# Altium schematic sheet VFD-Support-Sheet.SchDoc (part 1 of 3)
size 420 x 297 mm; SheetNumber: 13; SheetTotal: 15
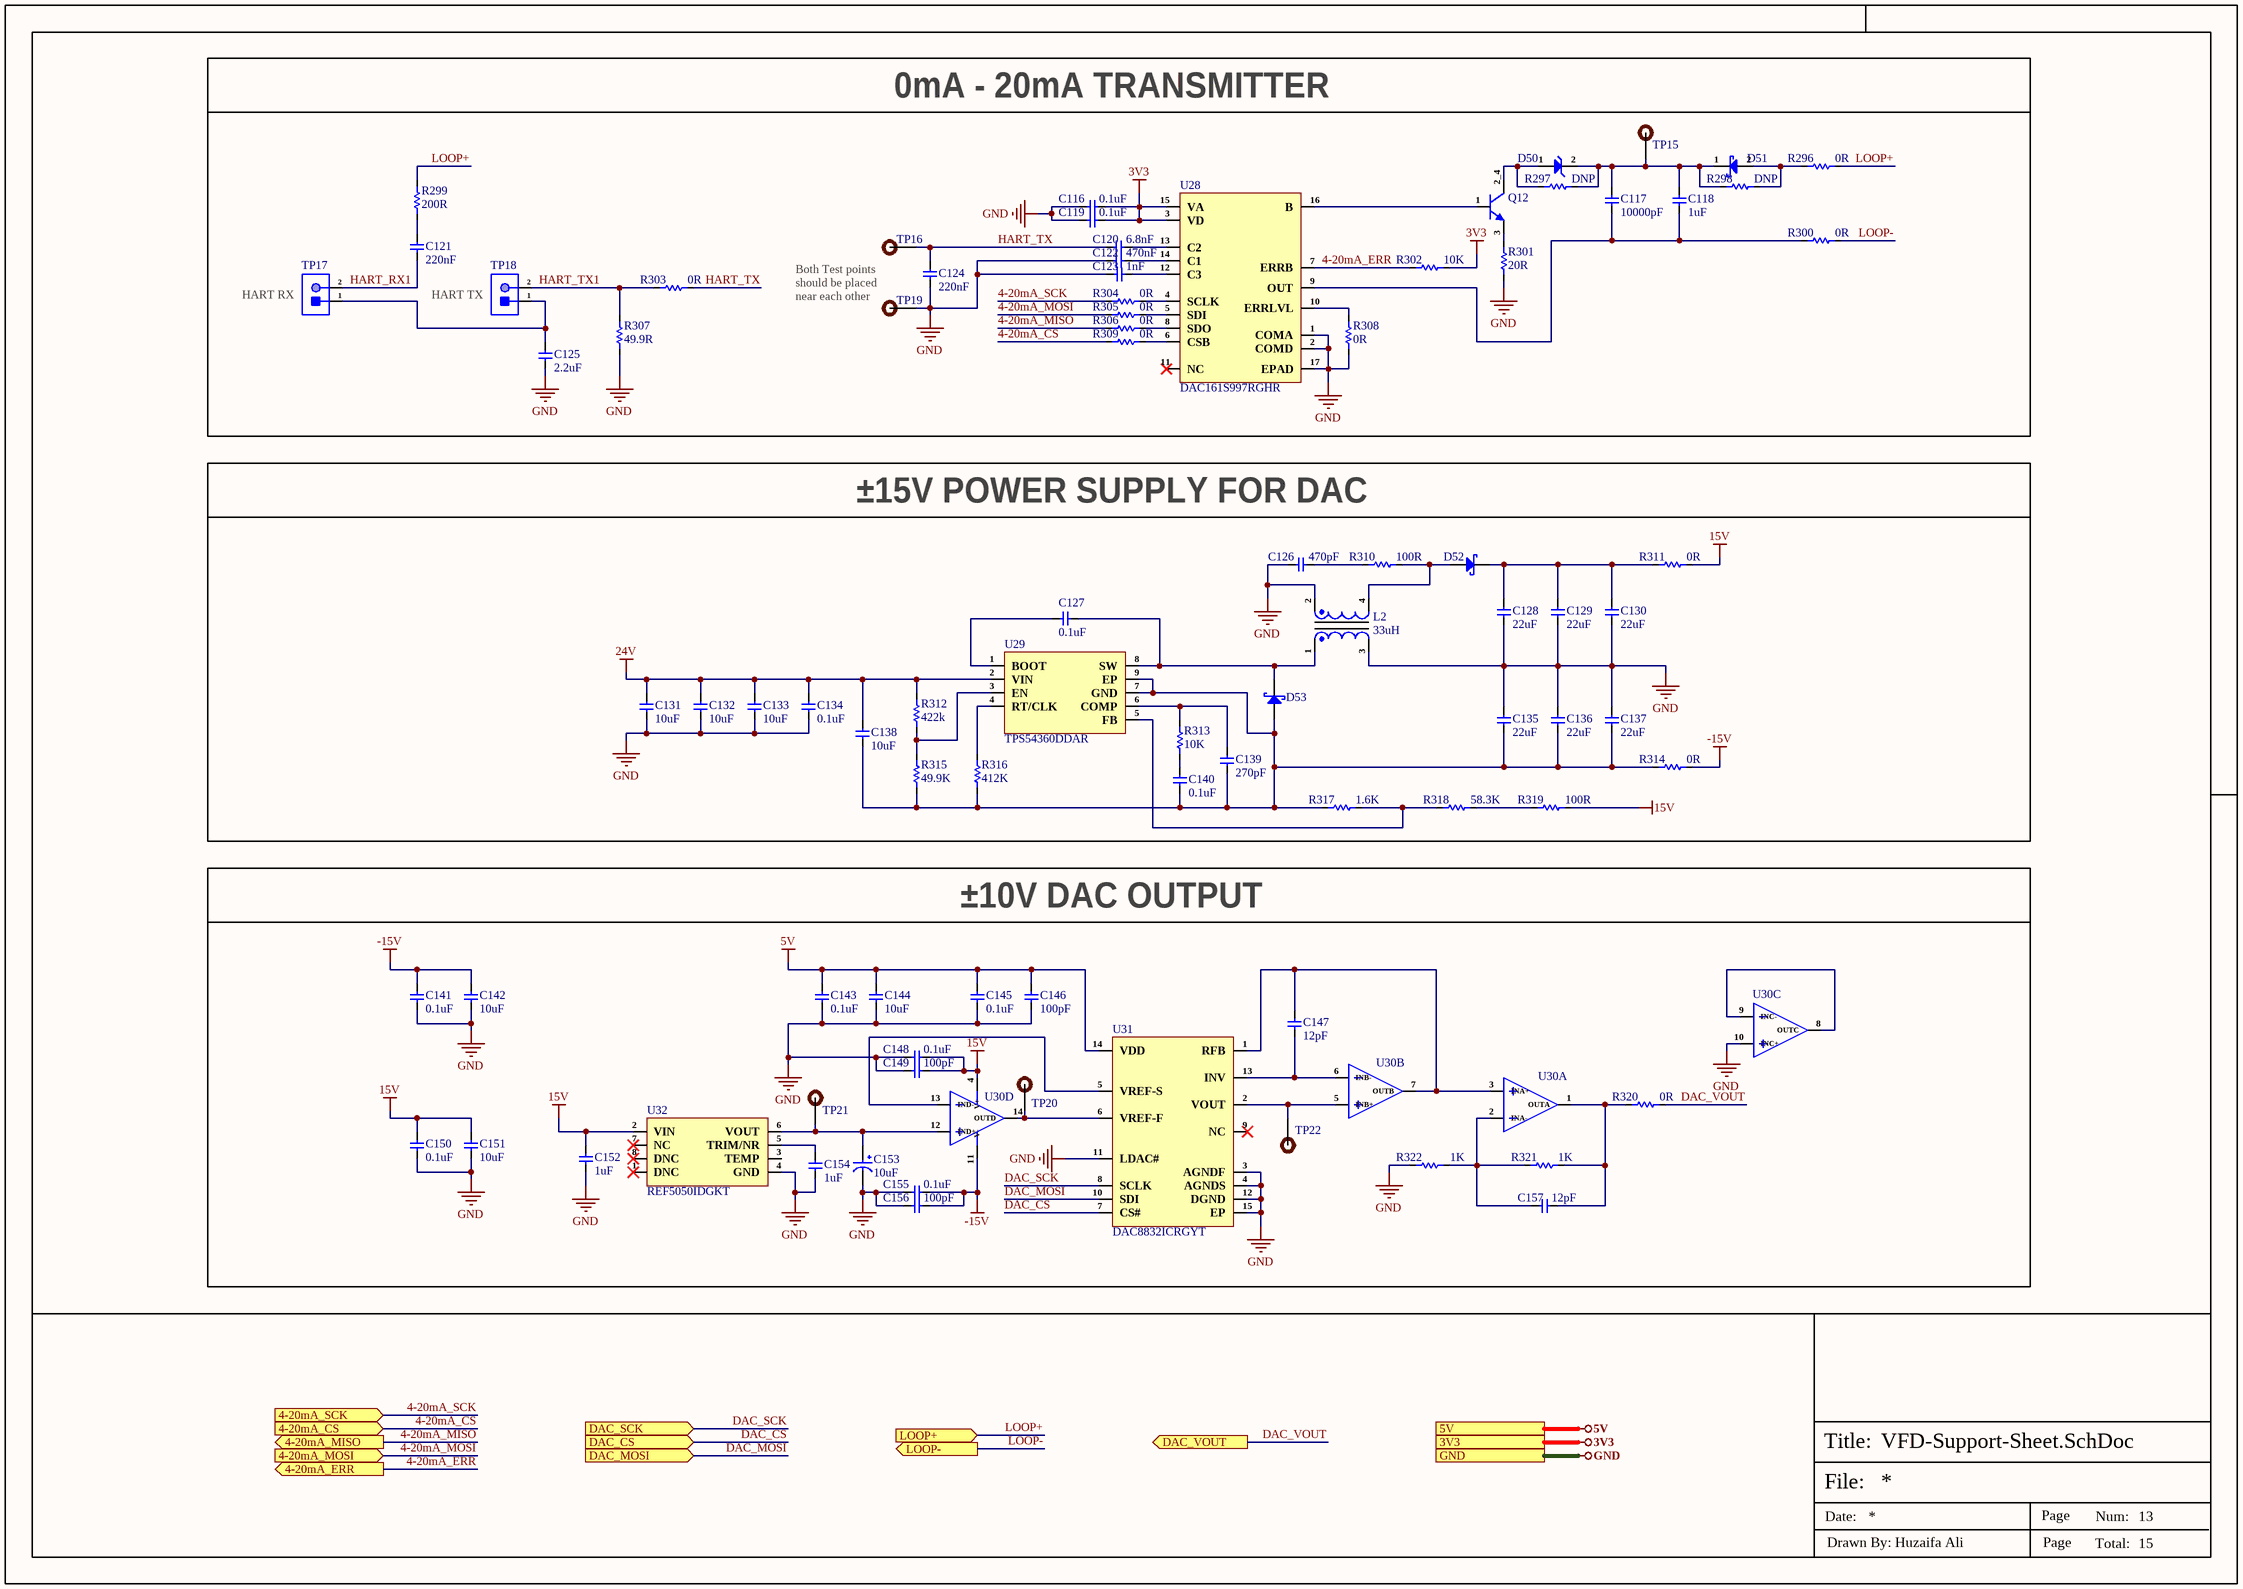
[diagram p0: VFD-Support-Sheet.SchDoc]

## Parts
C116  0.1uF  [Cap-0402]
C117  10000pF  [Cap-0603]
C118  1uF  [Cap-0603]
C119  0.1uF  [Cap-0402]
C120  6.8nF  [Cap-0603]
C121  220nF  [Cap-1206]
C122  470nF  [Cap-0603]
C123  1nF  [Cap-0402]
C124  220nF  [Cap-1206]
C125  2.2uF  [Cap-1206]
C126  470pF  [Cap-0603]
C127  0.1uF  [Cap-0603]
C128  22uF  [Cap-0805]
C129  22uF  [Cap-0805]
C130  22uF  [Cap-0805]
C131  10uF  [Cap-0805]
C132  10uF  [Cap-0805]
C133  10uF  [Cap-0805]
C134  0.1uF  [Cap-0603]
C135  22uF  [Cap-0805]
C136  22uF  [Cap-0805]
C137  22uF  [Cap-0805]
C138  10uF  [Cap-0805]
C139  270pF  [Cap-0402]
C140  0.1uF  [Cap-0603]
C141  0.1uF  [Cap-0603]
C142  10uF  [Cap-0805]
C143  0.1uF  [Cap-0603]
C144  10uF  [Cap-0805]
C145  0.1uF  [Cap-0603]
C146  100pF  [Cap-0402]
C147  12pF  [Cap-0402]
C148  0.1uF  [Cap-0603]
C149  100pF  [Cap-0402]
C150  0.1uF  [Cap-0603]
C151  10uF  [Cap-0805]
C152  1uF  [Cap-0603]
C153  10uF  [Case-C]
C154  1uF  [Cap-0603]
C155  0.1uF  [Cap-0603]
C156  100pF  [Cap-0402]
C157  12pF  [Cap-0402]
D50  3.9V  [SOD-123]  (value not drawn)
D51  B360A-13-F  [SMA(DO-214AC)]  (value not drawn)
D52  B360-13-F  [SMC]  (value not drawn)
D53  B360-13-F  [SMC]  (value not drawn)
L2  33uH  [MSD1278-333MLD]
Q12  PZT3904T1G  [PZT3904T1G]  (value not drawn)
R296  0R  [Res-0805]
R297  DNP  [Res-0805]
R298  DNP  [Res-0805]
R299  200R  [RES-0805]
R300  0R  [Res-0805]
R301  20R  [Res-0402]
R302  10K  [Res-0402]
R303  0R  [Res-0805]
R304  0R  [Res-0402]
R305  0R  [Res-0402]
R306  0R  [Res-0402]
R307  49.9R  [Res-0603]
R308  0R  [Res-0402]
R309  0R  [Res-0402]
R310  100R  [Res-0402]
R311  0R  [Res-0805]
R312  422k  [RES-0805]
R313  10K  [Res-0402]
R314  0R  [Res-0805]
R315  49.9K  [RES-0805]
R316  412K  [RES-0805]
R317  1.6K  [Res-0402]
R318  58.3K  [Res-0402]
R319  100R  [Res-0402]
R320  0R  [Res-0805]
R321  1K  [Res-0402]
R322  1K  [Res-0402]
TP15  TEST POINT  [Test-point]  (value not drawn)  (no BOM)
TP16  TEST POINT  [Test-point]  (value not drawn)  (no BOM)
TP17  2 Test Pad  [2 Test Pad]  (value not drawn)  (no BOM)
TP18  2 Test Pad  [2 Test Pad]  (value not drawn)  (no BOM)
TP19  TEST POINT  [Test-point]  (value not drawn)  (no BOM)
TP20  TEST POINT  [Test-point]  (value not drawn)  (no BOM)
TP21  TEST POINT  [Test-point]  (value not drawn)  (no BOM)
TP22  TEST POINT  [Test-point]  (value not drawn)  (no BOM)
U28  DAC161S997RGHR  [16-WQFN (4x4)]
U29  TPS54360DDAR  [8-SO PowerPad]
U30  OPA4192IPWR  [14-TSSOP]  (value not drawn)  (parts A,B,C,D of 4)
U31  DAC8832ICRGYT  [14-VQFN (3.5x3.5)]
U32  REF5050IDGKT  [VSSOP-8-0.65mm]

## Blocks framed on the sheet
0mA - 20mA TRANSMITTER: C116-C125 D50 D51 Q12 R296-R309 TP15-TP19 U28
±15V POWER SUPPLY FOR DAC: C126-C140 D52 D53 L2 R310-R319 U29
±10V DAC OUTPUT: C141-C157 R320-R322 TP20-TP22 U30-U32

## Ports
3V3 (see Top-Sheet[2D], Buttons-Lights-Sensors-Sheet[4D], CAN-Sheet[5D], Controller-Sheet-1[4D], Controller-Sheet-2[4D], EtherCAT-Sheet[1D], Ethernet-PHY-Sheet[4D], Power-Sheet[4D], RS232-Sheet[5D], RS485-Sheet[5D], USB-Sheet[4D]), 4-20mA_CS (in, see Top-Sheet[2D]), 4-20mA_ERR (out, see Top-Sheet[2D]), 4-20mA_MISO (out, see Top-Sheet[2D]), 4-20mA_MOSI (in, see Top-Sheet[2D]), 4-20mA_SCK (in, see Top-Sheet[2D]), 5V (see Top-Sheet[2D], Buttons-Lights-Sensors-Sheet[4D], CAN-Sheet[5D], Controller-Sheet-2[4D], Power-Sheet[4D], RS232-Sheet[5D], RS485-Sheet[5D], USB-Sheet[4D]), DAC_CS (in, see Top-Sheet[2D]), DAC_MOSI (in, see Top-Sheet[2D]), DAC_SCK (in, see Top-Sheet[2D]), DAC_VOUT (out, see Top-Sheet[2D], VFD-Support-Sheet2[3D]), GND (see Top-Sheet[2D], Buttons-Lights-Sensors-Sheet[4D], CAN-Sheet[6D], Controller-Sheet-1[4D], Controller-Sheet-2[4D], Controller-Sheet-3[4D], EtherCAT-Sheet[1D], Ethernet-PHY-Sheet[4D], Extra-DIOs[4D], Power-Sheet[4D], RS232-Sheet[5D], RS485-Sheet[5D], USB-Sheet[4D], VFD-Support-Sheet2[4D]), LOOP+ (in, see Top-Sheet[2D], VFD-Support-Sheet2[2D]), LOOP- (out, see Top-Sheet[2D], VFD-Support-Sheet2[2D])

## Nets
3V3: C116.1 C119.1 R302.2 U28.3(VD) U28.15(VA) ; port 3V3
5V: C143.2 C144.2 C145.2 C146.2 U31.14(VDD) ; port 5V
15V: C148.1 C149.1 C150.2 C151.2 C152.2 R311.2 R319.2 U30.4(V+) U32.2(VIN)
24V: C131.2 C132.2 C133.2 C134.2 C138.2 R312.2 U29.2(VIN)
-15V: C141.2 C142.2 C155.1 C156.1 R314.2 U30.11(V-)
GND: C116.2 C119.2 C122.1 C123.2 C124.2 C125.1 C126.1 C128.1 C129.1 C130.1 C131.1 C132.1 C133.1 C134.1 C135.2 C136.2 C137.2 C141.1 C142.1 C143.1 C144.1 C145.1 C146.1 C148.2 C149.2 C150.1 C151.1 C152.1 C153.2 C154.1 C155.2 C156.2 L2.2 L2.3 R301.1 R307.1 R308.2 R322.1 TP19.1 U28.1(COMA) U28.2(COMD) U28.17(EPAD) U30.10(INC+) U31.3(AGNDF) U31.4(AGNDS) U31.11(LDAC#) U31.12(DGND) U31.15(EP) U32.4(GND) ; port GND
4-20mA_CS: R309.1 ; port 4-20mA_CS
4-20mA_ERR: R302.1 U28.7(ERRB) ; port 4-20mA_ERR
4-20mA_MISO: R306.1 ; port 4-20mA_MISO
4-20mA_MOSI: R305.1 ; port 4-20mA_MOSI
4-20mA_SCK: R304.1 ; port 4-20mA_SCK
DAC_CS: U31.7(CS#) ; port DAC_CS
DAC_MOSI: U31.10(SDI) ; port DAC_MOSI
DAC_SCK: U31.8(SCLK) ; port DAC_SCK
DAC_VOUT: R320.2 ; port DAC_VOUT
HART_RX1: C121.2 TP17.2
HART_TX: C120.1 C124.1 R303.2 TP16.1
HART_TX1: R303.1 R307.2 TP18.2
LOOP+: R296.2 R299.2 ; port LOOP+
LOOP-: R300.2 ; port LOOP-
NetC117_1: C117.1 C118.1 R300.1 U28.9(OUT)
NetC117_2: C117.2 C118.2 D50.2(K) D51.1(K) R297.2 R298.1 TP15.1
NetC120_2: C120.2 U28.13(C2)
NetC121_1: C121.1 R299.1
NetC122_2: C122.2 U28.14(C1)
NetC123_1: C123.1 U28.12(C3)
NetC125_2: C125.2 TP17.1 TP18.1
NetC126_2: C126.2 R310.1
NetC127_1: C127.1 D53.1(K) L2.1 U29.8(SW)
NetC127_2: C127.2 U29.1(BOOT)
NetC128_2: C128.2 C129.2 C130.2 D52.1(K) R311.1
NetC135_1: C135.1 C136.1 C137.1 C138.1 C139.1 C140.2 D53.2(A) R314.1 R315.1 R316.1 R317.1 U29.7(GND) U29.9(EP)
NetC139_2: C139.2 R313.2 U29.6(COMP)
NetC140_1: C140.1 R313.1
NetC147_1: C147.1 U30.6(INB-) U31.13(INV)
NetC147_2: C147.2 U30.3(INA+) U30.7(OUTB) U31.1(RFB)
NetC153_1: C153.1 TP21.1 U30.12(IND+) U32.6(VOUT)
NetC154_2: C154.2 U32.5(TRIM/NR)
NetC157_1: C157.1 R320.1 R321.2 U30.1(OUTA)
NetC157_2: C157.2 R321.1 R322.2 U30.2(INA-)
NetD50_1: D50.1(A) Q12.2_4(C) R297.1
NetD51_2: D51.2(A) R296.1 R298.2
NetD52_2: D52.2(A) L2.4 R310.2
NetQ12_1: Q12.1(B) U28.16(B)
NetQ12_3: Q12.3(E) R301.2
NetR304_2: R304.2 U28.4(SCLK)
NetR305_2: R305.2 U28.5(SDI)
NetR306_2: R306.2 U28.8(SDO)
NetR308_1: R308.1 U28.10(ERRLVL)
NetR309_2: R309.2 U28.6(CSB)
NetR312_1: R312.1 R315.2 U29.3(EN)
NetR316_2: R316.2 U29.4(RT/CLK)
NetR317_2: R317.2 R318.1 U29.5(FB)
NetR318_2: R318.2 R319.1
NetTP20_1: TP20.1 U30.14(OUTD) U31.6(VREF-F)
NetTP22_1: TP22.1 U30.5(INB+) U31.2(VOUT)
NetU30_8: U30.8(OUTC) U30.9(INC-)
NetU30_13: U30.13(IND-) U31.5(VREF-S)

Not connected (* = marked no-connect by the designer): U28 11(NC)*; U31 9(NC)*; U32 1(DNC)* 3(TEMP) 7(NC)* 8(DNC)*

## Notes on the sheet
- (near TP17) HART RX
- HART TX
- Both Test points should be placed near each other
- File:
- Title:
- Date:
- Page
- Num:
- Total:
- Drawn By: Huzaifa Ali